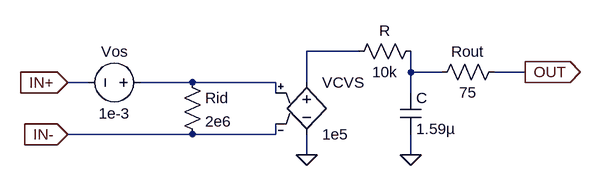
[diagram p0: schematic OP-AMP.asc]
OP-AMP.asc, the LTspice schematic file:
Version 4.1
SHEET 1 892 680
WIRE 528 0 448 0
WIRE 608 32 608 0
WIRE 656 32 608 32
WIRE 784 32 736 32
WIRE 112 48 80 48
WIRE 272 48 192 48
WIRE 400 48 272 48
WIRE 448 48 448 0
WIRE 400 64 400 48
WIRE 608 64 608 32
WIRE 272 128 80 128
WIRE 400 128 400 112
WIRE 400 128 272 128
WIRE 448 160 448 128
WIRE 608 160 608 128
FLAG 80 128 IN-
IOPIN 80 128 In
FLAG 80 48 IN+
IOPIN 80 48 In
FLAG 448 160 0
FLAG 608 160 0
FLAG 784 32 OUT
IOPIN 784 32 Out
SYMBOL voltage 208 48 R90
WINDOW 0 -32 56 VBottom 2
WINDOW 3 32 56 VTop 2
WINDOW 123 0 0 Left 0
WINDOW 39 0 0 Left 0
SYMATTR InstName Vos
SYMATTR Value 1e-3
SYMBOL res 256 32 R0
SYMATTR InstName Rid
SYMATTR Value 2e6
SYMBOL e 448 32 R0
SYMATTR InstName VCVS
SYMATTR Value 1e5
SYMBOL res 624 -16 R90
WINDOW 0 0 56 VBottom 2
WINDOW 3 32 56 VTop 2
SYMATTR InstName R
SYMATTR Value 10k
SYMBOL cap 592 64 R0
SYMATTR InstName C
SYMATTR Value 1.59µ
SYMBOL res 752 16 R90
WINDOW 0 0 56 VBottom 2
WINDOW 3 32 56 VTop 2
SYMATTR InstName Rout
SYMATTR Value 75

The netlist it stands for:
* OP-AMP.asc
Vos N003 IN+ 1e-3
Rid N003 IN- 2e6
E§VCVS N001 0 N003 IN- 1e5
R N002 N001 10k
C N002 0 1.59µ
Rout OUT N002 75
.backanno
.end